# Altium project Xponent-tech.PrjPcb (part 2 of 2)

## Sheet 3_Band_Filter.SchDoc
size A4; DocumentNumber: 2; SheetNumber: 3; SheetTotal: 4
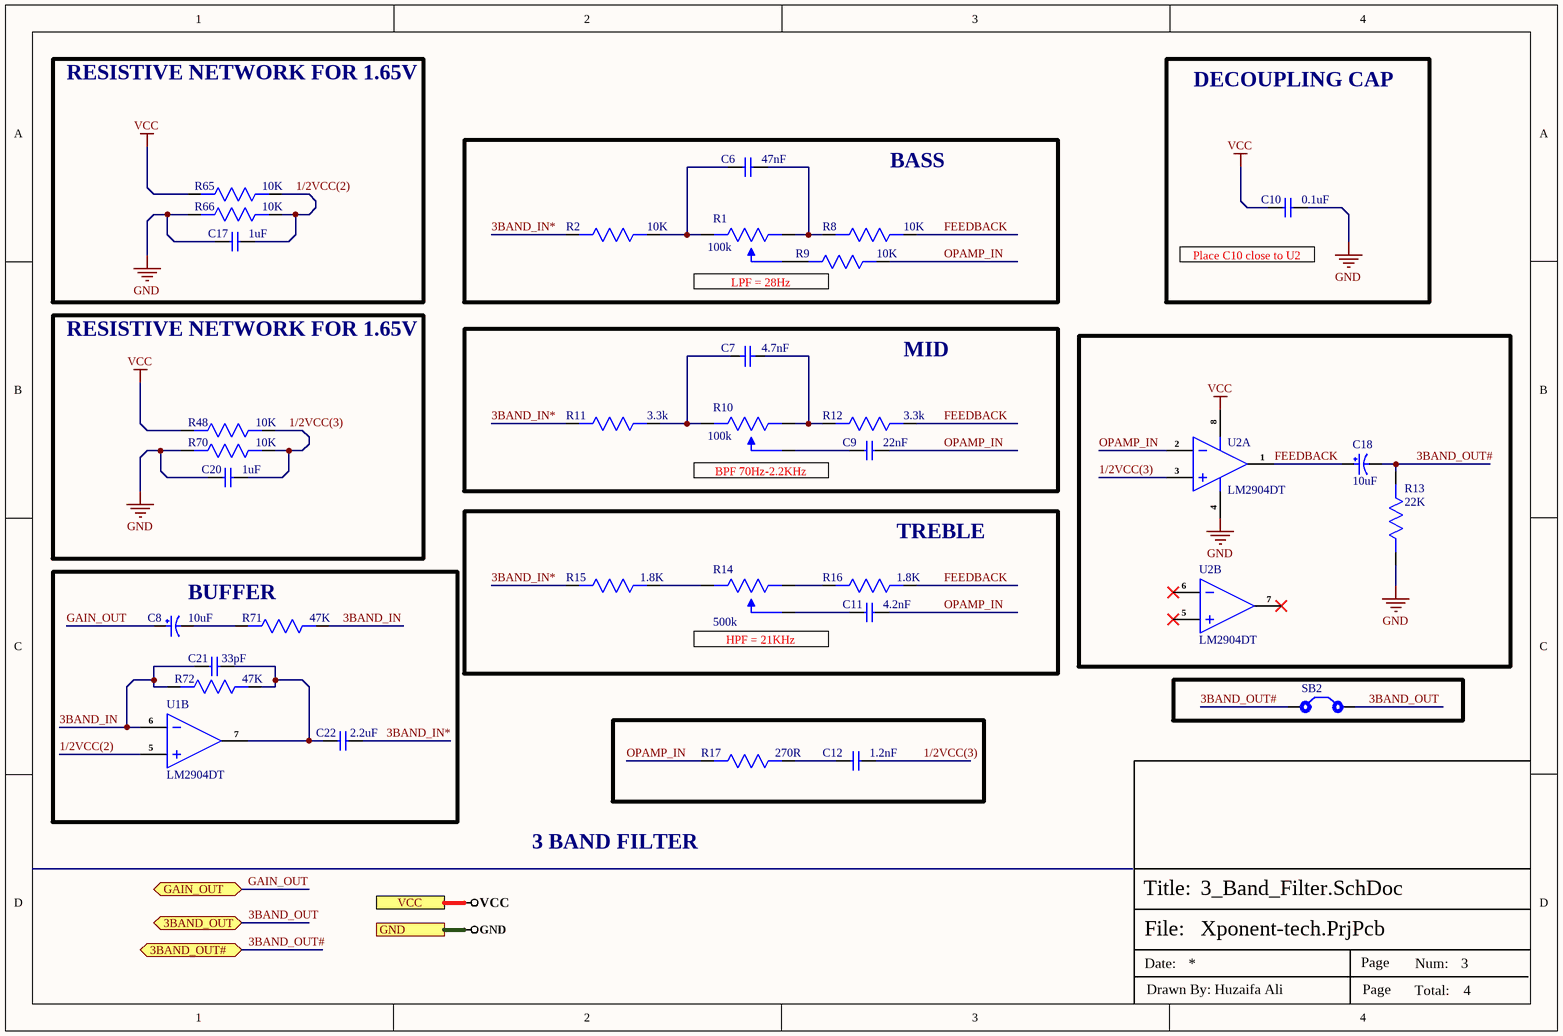
[diagram p2: 3_Band_Filter.SchDoc]

### Parts
C6  47nF  [Cap-0603]
C7  4.7nF  [Cap-0603]
C8  10uF  [RVT1E100M0405_]
C9  22nF  [Cap-0603]
C10  0.1uF  [CAP-0603]
C11  4.2nF  [Cap-0402]
C12  1.2nF  [Cap-0402]
C17  1uF  [Cap-0603]
C18  10uF  [RVT1E100M0405_]
C20  1uF  [Cap-0603]
C21  33pF  [Cap-0402]
C22  2.2uF  [Cap-0603]
R1  100k  [3296W_]
R2  10K  [Res-0603]
R8  10K  [Res-0603]
R9  10K  [Res-0603]
R10  100k  [3296W_]
R11  3.3k  [Res-0603]
R12  3.3k  [Res-0603]
R13  22K  [Res-0603]
R14  500k  [3296W_]
R15  1.8K  [Res-0603]
R16  1.8K  [Res-0603]
R17  270R  [Res-0603]
R48  10K  [Res-0603]
R65  10K  [Res-0603]
R66  10K  [Res-0603]
R70  10K  [Res-0603]
R71  47K  [Res-0603]
R72  47K  [Res-0603]
SB2  Solder Bridge  [Solder Bridge]  (value not drawn)
U1  LM2904DT  [SOIC-8]  (part B of 2)
U2  LM2904DT  [SOIC-8]  (parts A,B of 2)

### Blocks framed on the sheet
RESISTIVE NETWORK FOR 1.65V: C17 R65 R66
DECOUPLING CAP: C10
BASS: C6 R1 R2 R8 R9
RESISTIVE NETWORK FOR 1.65V: C20 R48 R70
MID: C7 C9 R10-R12
TREBLE: C11 R14-R16
BUFFER: C8 C21 C22 R71 R72 U1

### Ports
3BAND_OUT (bidir), 3BAND_OUT# (bidir), GAIN_OUT (bidir), GND, VCC

### Nets
GND: C10.2 C17.1 C20.1 R13.2 R66.2 R70.2 U2.4(VCC-) ; port GND
VCC: C10.1 R48.2 R65.2 U2.8(VCC+) ; port VCC
1/2VCC(2): C17.2 R65.1 R66.1 U1.5(2IN+)
1/2VCC(3): C12.2 C20.2 R48.1 R70.1 U2.3(IN+)
3BAND_IN: C21.1 R71.1 R72.2 U1.6(2IN-)
3BAND_IN*: C22.2 R2.2 R11.2 R15.2
3BAND_OUT: SB2.2 ; port 3BAND_OUT
3BAND_OUT#: C18.2 R13.1 SB2.1 ; port 3BAND_OUT#
FEEDBACK: C18.1 R8.1 R12.1 R16.1 U2.1(1OUT)
GAIN_OUT: C8.1 ; port GAIN_OUT
OPAMP_IN: C9.2 C11.2 R9.1 R17.2 U2.2(IN-)
NetC6_1: C6.1 R1.3(CW) R2.1
NetC6_2: C6.2 R1.1(CCW) R8.2
NetC7_1: C7.1 R10.1(CCW) R12.2
NetC7_2: C7.2 R10.3(CW) R11.1
NetC8_2: C8.2 R71.2
NetC9_1: C9.1 R10.2(Wiper)
NetC11_1: C11.1 R14.2(Wiper)
NetC12_1: C12.1 R17.1
NetC21_2: C21.2 C22.1 R72.1 U1.7(2OUT)
NetR1_2: R1.2(Wiper) R9.2
NetR14_1: R14.1(CCW) R16.2
NetR14_3: R14.3(CW) R15.1

Not connected (* = marked no-connect by the designer): U2 5(2IN+)* 6(2IN-)* 7(2OUT)*

### Notes on the sheet
- LPF = 28Hz
- (near C10) Place C10 close to U2
- (near R10) BPF 70Hz-2.2KHz
- (near R14) HPF = 21KHz
- 3 BAND FILTER
- File:
- Title:
- Date:
- Page
- Num:
- Total:
- Drawn By: Huzaifa Ali

### Library data of the parts
C6 = CGA3E2X8R1H473M080AA: CAP CER 0.047UF 50V X8R 0603; Manufacturer: TDK; Tolerance: 20%; Supplier 1: Digi-Key; Manufacturer Part Number: CGA3E2X8R1H473M080AA; RoHS: Yes; Category: Ceramic Capacitors; Stock 1: 1279; Pricing 1: 1=0.16000, 10=0.11200, 50=0.06360, 100=0.05260, 500=0.03690, 1000=0.03055 (USD); Mount: Surface Mount; Case/Package: 0603; Case Code (Metric): 1608; Weight: 7.1E-05oz; Case Code (Imperial): 0603; Min Operating Temperature: -55°C; Max Operating Temperature: 150°C; Dielectric: X8R; Voltage Rating (DC): 50V; Package Quantity: 4000; Packaging: Tape and Reel; Capacitance: 47nF; Voltage Rating: 50V; Features: High Temperature; Length: 0.063inch; Width: 0.031inch; Height: 0.8mm; Thickness: 0.035inch; Ratings: AEC-Q200; ComponentLink1URL: http://www.mouser.com/ds/2/400/mlcc_automotive_hightemp_en-520039.pdf?src-supplier=Mouser; ComponentLink1Description: http://www.mouser.com/ds/2/400/mlcc_automotive_hightemp_en-520039.pdf?src-supplier=Mouser; ComponentLink2URL: https://product.tdk.com/info/en/catalog/spec/mlccspec_automotive_hightemp_en.pdf?src-supplier=Digi-Key; ComponentLink2Description: https://product.tdk.com/info/en/catalog/spec/mlccspec_automotive_hightemp_en.pdf?src-supplier=Digi-Key; ComponentLink3URL: http://product.tdk.com/en/catalog/datasheets/mlcc_automotive_hightemp_en.pdf?src-supplier=Avnet; ComponentLink3Description: http://product.tdk.com/en/catalog/datasheets/mlcc_automotive_hightemp_en.pdf?src-supplier=Avnet; Supplier Part Number 1: 445-12603-1-ND; LCSC Part Number: C2172709
C7 = CC0603JRNPO9BN472: CAP CER 4700PF 50V C0G/NPO 0603; Manufacturer: Yageo; Item Type: Capacitor; Supplier 1: Digi-Key; Manufacturer Part Number: CC0603JRNPO9BN472; RoHS: Yes; Category: Ceramic Capacitors; Stock 1: 31779; Pricing 1: 1=0.48000, 10=0.33000, 50=0.23100, 100=0.19800, 500=0.14854, 1000=0.12543 (USD); RoHS Compliant: Yes; Supplier Part Number 1: 13-CC0603JRNPO9BN472CT-ND; LCSC Part Number: C576818; ComponentLink1Description: LCSC; ComponentLink1URL: https://www.lcsc.com/product-detail/Multilayer-Ceramic-Capacitors-MLCC-SMD-SMT_YAGEO-CC0603JRNPO9BN472_C576818.html
C8 C18 = RVT1E100M0405: CAP ALUM 10uF 25V SMD; Manufacturer: ROQANG; φD: 4mm; L: 5.4mm; Tolerance: ±20%; Item Type: Capacitor; Operating Temperature: -45℃~+105℃; Rated Voltage: 25V; Capacitance: 10uF; Manufacturer Part Number: RVT1E100M0405; ComponentLink1Description: LCSC; ComponentLink1URL: https://www.lcsc.com/product-detail/Aluminum-Electrolytic-Capacitors-SMD_10uF-25V-20_C72484.html; LCSC Part Number: C970655
C9 = CGA3E2X7R2A223K080AA: CAP CER 0.022UF 100V X7R 0603; Manufacturer: TDK; Tolerance: 10%; Supplier 1: Digi-Key; Manufacturer Part Number: CGA3E2X7R2A223K080AA; RoHS: Yes; Category: Ceramic Capacitors; Stock 1: 56079; Pricing 1: 1=0.11000, 10=0.07600, 50=0.04340, 100=0.03590, 500=0.02516, 1000=0.02083 (USD); Mount: Surface Mount; Case/Package: 0603; Case Code (Metric): 1608; Case Code (Imperial): 0603; Weight: 7.1E-05oz; Min Operating Temperature: -55°C; Max Operating Temperature: 125°C; Capacitance: 22nF; Voltage Rating: 100V; Packaging: Tape and Reel; Voltage Rating (DC): 100V; Dielectric: X7R; Termination: SMD/SMT; Series: CGA; Package Quantity: 1; Resistor Type: Ceramic; Length: 1.6mm; Width: 0.031inch; Height: 0.8mm; Thickness: 0.035inch; Depth: 0.8mm; Ratings: AEC-Q200; RoHS Compliant: Yes; REACH SVHC: No SVHC; ComponentLink1URL: https://datasheet.ciiva.com/22725/1735406-22725648.pdf?src-supplier=Element14; ComponentLink1Description: https://datasheet.ciiva.com/22725/1735406-22725648.pdf?src-supplier=Element14; ComponentLink2URL: https://datasheet.ciiva.com/24218/cga3e2x7r2a223k080aa-266292-24218959.pdf?src-supplier=Mouser; ComponentLink2Description: https://datasheet.ciiva.com/24218/cga3e2x7r2a223k080aa-266292-24218959.pdf?src-supplier=Mouser; ComponentLink3URL: https://datasheet.ciiva.com/7975/1807242-7975349.pdf?src-supplier=Element14; ComponentLink3Description: https://datasheet.ciiva.com/7975/1807242-7975349.pdf?src-supplier=Element14; Supplier Part Number 1: 445-5814-1-ND; LCSC Part Number: C2167165
C10 = CL10B104KB8NNNL: CAP CER 0.1UF 50V X7R 0603; Manufacturer: Samsung; Capacitance: 100nF; Tolerance: 10%; Supplier 1: Digi-Key; Manufacturer Part Number: CL10B104KB8NNNL; Stock 1: 3731229; Pricing 1: 1=0.1, 10=0.03, 50=0.0164, 100=0.0134, 500=0.00958, 1000=0.00753, 2500=0.00684, 5000=0.0063 (USD); Mount: Surface Mount; Case/Package: 0603; Min Operating Temperature: -55°C; Max Operating Temperature: 125°C; Dielectric: X7R; Packaging: Tape and Reel; Package Quantity: 15000; Voltage Rating: 50V; Voltage Rating (DC): 50V; Series: CL; Construction: Flat; Length: 1.6mm; Width: 0.031inch; Height: 0.8mm; Thickness: 0.035inch; Depth: 0.8mm; Radiation Hardening: No; RoHS Compliant: Yes; ComponentLink1URL: https://www.verical.com/server-webapp/html/getDatasheet?partID=357523&src-supplier=Verical; ComponentLink1Description: https://www.verical.com/server-webapp/html/getDatasheet?partID=357523&src-supplier=Verical; ComponentLink2URL: https://media.digikey.com/pdf/Data%20Sheets/Samsung%20PDFs/CL_Series_MLCC_ds.pdf?src-supplier=Digi-Key; ComponentLink2Description: https://media.digikey.com/pdf/Data%20Sheets/Samsung%20PDFs/CL_Series_MLCC_ds.pdf?src-supplier=Digi-Key; Supplier Part Number 1: 1276-CL10B104KB8NNNLCT-ND; LCSC Part Number: C913912
C11 = GCM155R72A472KA01D: 100V 4.2nF X7R ±10% 0402 Multilayer Ceramic Capacitors MLCC - SMD/SMT ROHS; Manufacturer: Murata Electronics; Manufacturer Part Number: GCM155R72A472KA01D; LCSC Part Number: C2980803; Item Type: Capacitor; ComponentLink1Description: LCSC; ComponentLink1URL: https://www.lcsc.com/product-detail/Multilayer-Ceramic-Capacitors-MLCC-SMD-SMT_Murata-Electronics-GCM155R72A472KA01D_C2980803.html; Value: 4.2nF
C12 = C0402C122K3RAC7867: CAP CER 1200PF 25V X7R 0402; Manufacturer: KEMET; Dielectric Material: Ceramic; Tolerance: 10%; Supplier 1: Digi-Key; Manufacturer Part Number: C0402C122K3RAC7867; Stock 1: 13198; Pricing 1: 1=0.38, 10=0.266, 50=0.1864, 100=0.1597, 500=0.1198, 1000=0.10117, 2500=0.09584, 5000=0.09052 (USD); Mount: Surface Mount; Case/Package: 0402; Contact Plating: Tin,Matte; Min Operating Temperature: -55°C; Max Operating Temperature: 125°C; Capacitance: 1.2nF; Dielectric: X7R; Packaging: Tape and Reel; Voltage Rating (DC): 25V; Construction: Flat; Length: 1mm; Height: 0.5mm; Depth: 0.5mm; Radiation Hardening: No; RoHS Compliant: Yes; Supplier Part Number 1: 399-14419-1-ND; LCSC Part Number: C3895723
C17 C20 = UMK107AB7105KA-T: CAP CER 1UF 50V X7R 0603; Manufacturer: Taiyo Yuden; Tolerance: 10%; Item Type: Capacitor; ComponentLink1URL: http://www.farnell.com/datasheets/2048165.pdf?src-supplier=Element14; ComponentLink1Description: http://www.farnell.com/datasheets/2048165.pdf?src-supplier=Element14; ComponentLink2URL: https://www.murata.com/~/media/webrenewal/support/library/catalog/products/capacitor/mlcc/c02e.ashx?la=en-us&src-supplier=Digi-Key; ComponentLink2Description: https://www.murata.com/~/media/webrenewal/support/library/catalog/products/capacitor/mlcc/c02e.ashx?la=en-us&src-supplier=Digi-Key; Supplier 1: Digi-Key; Manufacturer Part Number: UMK107AB7105KA-T; Stock 1: 453098; Pricing 1: 1=0.28, 10=0.19, 100=0.1079, 500=0.0762, 1000=0.0667 (USD); Mount: Surface Mount; Case/Package: 0603; Case Code (Metric): 1608; Case Code (Imperial): 0603; Min Operating Temperature: -55°C; Max Operating Temperature: 125°C; Packaging: Tape and Reel; Package Quantity: 1; Capacitance: 1uF; Voltage Rating: 50V; Voltage Rating (DC): 50V; Dielectric: X7R; Termination: SMD/SMT; Length: 1.6mm; Height: 0.8mm; Width: 0.031inch; Thickness: 0.037inch; Depth: 0.8mm; Radiation Hardening: No; Halogen Free: Halogen Free; ComponentLink3URL: https://www.yuden.co.jp/productdata/catalog/mlcc_all_e.pdf?src-supplier=Digi-Key; ComponentLink3Description: https://www.yuden.co.jp/productdata/catalog/mlcc_all_e.pdf?src-supplier=Digi-Key; ComponentLink4URL: https://www.yuden.co.jp/productdata/catalog/mlcc_all_e.pdf?src-supplier=Onlinecomponents.com; ComponentLink4Description: https://www.yuden.co.jp/productdata/catalog/mlcc_all_e.pdf?src-supplier=Onlinecomponents.com; Supplier Part Number 1: 587-3247-1-ND; LCSC Part Number: C105174
C21 = GRM1555C1E330JA01D: CAP CER 33PF 25V C0G/NP0 0402; Manufacturer: Murata; Tolerance: 5%; Dielectric: C0G; Supplier 1: Digi-Key; Manufacturer Part Number: GRM1555C1E330JA01D; Stock 1: 250773; Pricing 1: 1=0.1, 10=0.034, 50=0.0184, 100=0.0151, 500=0.01078, 1000=0.00847, 2500=0.0077, 5000=0.00708 (USD); Mount: Surface Mount; Case/Package: 0402; Case Code (Metric): 1005; Case Code (Imperial): 0402; Min Operating Temperature: -55°C; Max Operating Temperature: 125°C; Capacitance: 33pF; Package Quantity: 1; Voltage Rating: 25V; Packaging: Tape and Reel; Voltage Rating (DC): 25V; Termination: SMD/SMT; Voltage: 25V; Series: GRM; Construction: Flat; Length: 1mm; Width: 0.02inch; Height: 0.5mm; Thickness: 0.022inch; Depth: 0.5mm; Radiation Hardening: No; Lead Free: Lead Free; RoHS Compliant: Yes; ComponentLink1URL: https://www.murata.com/~/media/webrenewal/support/library/catalog/products/capacitor/mlcc/c02e.ashx?la=en-us&src-supplier=Digi-Key; ComponentLink1Description: https://www.murata.com/~/media/webrenewal/support/library/catalog/products/capacitor/mlcc/c02e.ashx?la=en-us&src-supplier=Digi-Key; ComponentLink2URL: http://www.mouser.com/ds/2/281/c02e-2905.pdf?src-supplier=Mouser; ComponentLink2Description: http://www.mouser.com/ds/2/281/c02e-2905.pdf?src-supplier=Mouser; ComponentLink3URL: http://psearch.murata.com/capacitor/product/GRM1555C1E330JA01%23.pdf?src-supplier=Avnet; ComponentLink3Description: http://psearch.murata.com/capacitor/product/GRM1555C1E330JA01%23.pdf?src-supplier=Avnet; Supplier Part Number 1: 490-6177-1-ND; LCSC Part Number: C441758
C22 = GRM188R6YA225KA12D: CAP, 2.2µF, 35V, 10%, X5R, 0603; Manufacturer: Murata; Material: Ceramic; Supplier 1: Digi-Key; Manufacturer Part Number: GRM188R6YA225KA12D; RoHS: Yes; Category: Ceramic Capacitors; Stock 1: 81665; Pricing 1: 1=0.21000, 10=0.14100, 50=0.08480, 100=0.07170, 500=0.04904, 1000=0.04338 (USD); Mount: Surface Mount; Case/Package: 0603; Case Code (Metric): 1608; Case Code (Imperial): 0603; Weight: 0.000222oz; Min Operating Temperature: -55°C; Max Operating Temperature: 85°C; Package Quantity: 4000; Packaging: Tape and Reel; Capacitance: 2.2uF; Tolerance: 10%; Voltage Rating: 35V; Dielectric: X5R; Voltage: 35V; Termination: SMD/SMT; Voltage Rating (DC): 35V; Series: GRM; Length: 1.6mm; Width: 0.8mm; Height: 0.8mm; Thickness: 0.035inch; Depth: 0.8mm; REACH SVHC: No SVHC; Lead Free: Lead Free; RoHS Compliant: Yes; ComponentLink1URL: https://datasheet.ciiva.com/14906/partnumbering-e-01-14906490.pdf?src-supplier=Digi-Key; ComponentLink1Description: https://datasheet.ciiva.com/14906/partnumbering-e-01-14906490.pdf?src-supplier=Digi-Key; ComponentLink2URL: https://datasheet.ciiva.com/14906/partnumbering-e-01-14906491.pdf?src-supplier=Digi-Key; ComponentLink2Description: https://datasheet.ciiva.com/14906/partnumbering-e-01-14906491.pdf?src-supplier=Digi-Key; ComponentLink3URL: https://datasheet.ciiva.com/14906/partnumbering-e-01-14906492.pdf?src-supplier=Digi-Key; ComponentLink3Description: https://datasheet.ciiva.com/14906/partnumbering-e-01-14906492.pdf?src-supplier=Digi-Key; Supplier Part Number 1: 490-7204-1-ND; LCSC Part Number: C86017
R1 R10 = 3296W-1-104: Trimmer, Cermet, Rest 100 Kilohms, PCB, 25 Turns, Pwr-Rtg 0.5W, 3296 Series; Manufacturer: BOCHEN(Chengdu Guosheng Tech); Item Type: Potentiometer; Manufacturer Part Number: 3296W-1-104; LCSC Part Number: C330435; Value: 100k; ComponentLink1Description: LCSC; ComponentLink1URL: https://www.lcsc.com/product-detail/Variable-Resistors-Potentiometers_BOCHEN-Chengdu-Guosheng-Tech-3296W-1-104_C330435.html
R2 R8 R9 R48 R65 R66 R70 = RT0603BRD0710KL: RES SMD 10K OHM 0.1% 1/10W 0603; Manufacturer: Yageo; Power: 100mW; Rated Temperature: 70°C; Value: 10kR; Temperature Coefficient: 25ppm/°C; Working Voltage: 75V; Package Height: 0.45mm; Package Length: 1.6mm; Package Width: 0.8mm; Item Type: Resistor; Supplier 1: Rs; Manufacturer Part Number: RT0603BRD0710KL; RoHS: Yes; Category: Chip SMD Resistors; Stock 1: 20510; Pricing 1: 100=0.29800, 250=0.27800, 500=0.25900, 1000=0.23700 (GBP); Mounting Technology: Surface Mount; Pins: 2; Case/Package: 0603; Min Operating Temperature: -55°C; Max Operating Temperature: 155°C; Tolerance: 0.1%; Resistor Type: FIXED RESISTOR; Construction: Chip; Package Style: SMTMeter; Packaging: Tape and Reel; Technology: THIN FILM; Termination: Wraparound; Reach SVHC Compliant: Yes; RoHS Compliant: Yes; ComponentLink1URL: https://datasheet.ciiva.com:443/pdfs/VipMasterIC/IC/YAGO/YAGO-S-A0008510989/YAGO-S-A0008510989-1.pdf?src-supplier=IHS+Markit; ComponentLink1Description: https://datasheet.ciiva.com:443/pdfs/VipMasterIC/IC/YAGO/YAGO-S-A0008510989/YAGO-S-A0008510989-1.pdf?src-supplier=IHS+Markit; ComponentLink2URL: https://datasheet.ciiva.com/5624/pyu-rt-1-to-0-05-rohs-l-4-5624351.pdf?src-supplier=Mouser; ComponentLink2Description: https://datasheet.ciiva.com/5624/pyu-rt-1-to-0-05-rohs-l-4-5624351.pdf?src-supplier=Mouser; ComponentLink3URL: https://datasheet.ciiva.com/29721/pyu-rt-1-to-0-05-rohs-l-4-29721177.pdf?src-supplier=Digi-Key; ComponentLink3Description: https://datasheet.ciiva.com/29721/pyu-rt-1-to-0-05-rohs-l-4-29721177.pdf?src-supplier=Digi-Key; Supplier Part Number 1: 1991391P; LCSC Part Number: C95204
R11 R12 = RT0603BRD073K3L: RES SMD 3.3K OHM 0.1% 1/10W 0603; Manufacturer: Yageo; Resistance: 3.3kR; Power Rating: 100mW; Voltage Rating: 75V; Temperature Coefficient: 25ppm/°C; Voltage Rating (DC): 50V; Item Type: Resistor; Supplier 1: Arrow Electronics; Manufacturer Part Number: RT0603BRD073K3L; RoHS: Yes; Category: Chip SMD Resistors; Stock 1: 2417; Pricing 1: 1=0.30610, 10=0.21080, 25=0.17430, 100=0.09180, 250=0.09000, 500=0.07600, 1000=0.04220 (USD); Case/Package: 0603; Case Code (Metric): 1608; Case Code (Imperial): 0603; Contact Plating: Tin,Lead; Min Operating Temperature: -55°C; Max Operating Temperature: 125°C; Package Quantity: 5000; Packaging: Tape and Reel; Tolerance: 0.1%; Resistor Type: Thin Film; Number of Terminations: 2; Termination: SMD/SMT; Max Power Dissipation: 100mW; Features: Moisture Resistant; Series: RT; Construction: Rectangular; Length: 0.063inch; Width: 0.031inch; Height: 0.022inch; Depth: 0.8mm; Military Standard: Not; Lead Free: Lead Free; RoHS Compliant: Yes; ComponentLink1URL: https://datasheet.ciiva.com/11814/0900766b8027bd26-11814026.pdf?src-supplier=Rs; ComponentLink1Description: https://datasheet.ciiva.com/11814/0900766b8027bd26-11814026.pdf?src-supplier=Rs; ComponentLink2URL: https://datasheet.ciiva.com/12694/pyu-rt-1-to-0-05-rohs-l-4-12694839.pdf?src-supplier=Mouser; ComponentLink2Description: https://datasheet.ciiva.com/12694/pyu-rt-1-to-0-05-rohs-l-4-12694839.pdf?src-supplier=Mouser; ComponentLink3URL: https://datasheet.ciiva.com/2585/pyu-rt-1-to-0-05-rohs-l-4-2585926.pdf?src-supplier=Digi-Key; ComponentLink3Description: https://datasheet.ciiva.com/2585/pyu-rt-1-to-0-05-rohs-l-4-2585926.pdf?src-supplier=Digi-Key; Supplier Part Number 1: RT0603BRD073K3L; LCSC Part Number: C309653
R13 = RT0603BRD0722KL: RES SMD 22K OHM 0.1% 1/10W 0603; Manufacturer: Yageo; Resistance: 22kR; Power Rating: 100mW; Voltage Rating: 75V; Temperature Coefficient: 25ppm/°C; Voltage Rating (DC): 50V; Item Type: Resistor; Supplier 1: Future Electronics; Manufacturer Part Number: RT0603BRD0722KL; RoHS: Yes; Category: Chip SMD Resistors; Stock 1: 75005; Pricing 1: 5000=0.02230, 15000=0.02150, 25000=0.02110, 50000=0.02060, 100000=0.01990 (USD); Case/Package: 0603; Case Code (Imperial): 0603; Case Code (Metric): 1608; Weight: 7.1E-05oz; Contact Plating: Tin,Lead; Min Operating Temperature: -55°C; Max Operating Temperature: 155°C; Packaging: Tape and Reel; Tolerance: 0.1%; Resistor Type: Thin Film; Number of Terminations: 2; Termination: SMD/SMT; Max Power Dissipation: 100mW; Features: Moisture Resistant; Series: RT; Length: 0.063inch; Width: 0.031inch; Height: 0.022inch; Lead Free: Lead Free; RoHS Compliant: Yes; ComponentLink1URL: https://datasheet.ciiva.com/12836/pyu-rt-1-to-0-05-rohs-l-4-12836650.pdf?src-supplier=Mouser; ComponentLink1Description: https://datasheet.ciiva.com/12836/pyu-rt-1-to-0-05-rohs-l-4-12836650.pdf?src-supplier=Mouser; LCSC Part Number: C469656; Supplier Part Number 1: 3017560
R14 = 3296W-1-504: Res Cermet Trimmer 500K Ohm 10% 1/2W 25(Elec)Turn; Manufacturer: BOCHEN(Chengdu Guosheng Tech); Item Type: Potentiometer; Manufacturer Part Number: 3296W-1-504; LCSC Part Number: C330437; ComponentLink1Description: LCSC; ComponentLink1URL: https://www.lcsc.com/product-detail/Variable-Resistors-Potentiometers_BOCHEN-Chengdu-Guosheng-Tech-3296W-1-504_C330437.html; Value: 500k
R15 R16 = RT0603BRD071K8L: RES SMD 1.8K OHM 0.1% 1/10W 0603; Manufacturer: Yageo; Resistance: 1.8kR; Temperature Coefficient: 25ppm/°C; Power Rating: 100mW; Voltage Rating: 75V; Voltage Rating (DC): 50V; Item Type: Resistor; Supplier 1: Rs; Manufacturer Part Number: RT0603BRD071K8L; RoHS: Yes; Category: Chip SMD Resistors; Stock 1: 3210; Pricing 1: 100=0.21900, 250=0.20400, 500=0.19000, 1000=0.17400 (GBP); Case/Package: 0603; Contact Plating: Tin,Matte; Case Code (Metric): 1608; Case Code (Imperial): 0603; Min Operating Temperature: -55°C; Max Operating Temperature: 125°C; Tolerance: 0.1%; Resistor Type: Thin Film; Package Quantity: 5000; Packaging: Tape and Reel; Number of Terminations: 2; Termination: SMD/SMT; Max Power Dissipation: 100mW; Features: Moisture Resistant; Series: RT; Construction: Rectangular; Length: 0.063inch; Width: 0.031inch; Height: 0.022inch; Depth: 0.8mm; Radiation Hardening: No; Military Standard: Not; Lead Free: Lead Free; RoHS Compliant: Yes; ComponentLink1URL: https://datasheet.ciiva.com/12694/pyu-rt-1-to-0-05-rohs-l-4-12694842.pdf?src-supplier=Mouser; ComponentLink1Description: https://datasheet.ciiva.com/12694/pyu-rt-1-to-0-05-rohs-l-4-12694842.pdf?src-supplier=Mouser; ComponentLink2URL: https://datasheet.ciiva.com/2585/pyu-rt-1-to-0-05-rohs-l-4-2585762.pdf?src-supplier=Digi-Key; ComponentLink2Description: https://datasheet.ciiva.com/2585/pyu-rt-1-to-0-05-rohs-l-4-2585762.pdf?src-supplier=Digi-Key; Supplier Part Number 1: 1991446P; LCSC Part Number: C705745
R17 = RT0603BRE07270RL: RES SMD 270 OHM 0.1% 1/10W 0603; Manufacturer: Yageo; Max Power Dissipation: 100mW; Temperature Coefficient: 50ppm/°C; Voltage Rating (DC): 50V; Item Type: Resistor; Supplier 1: Digi-Key; Manufacturer Part Number: RT0603BRE07270RL; RoHS: Yes; Category: Chip SMD Resistors; Pricing 1: 5000=0.04770 (USD); Case/Package: 0603; Min Operating Temperature: -55°C; Max Operating Temperature: 125°C; Resistance: 270R; Tolerance: 0.1%; Packaging: Tape and Reel; Package Quantity: 5000; Resistor Type: Thin Film; Number of Terminations: 2; Series: RT; Construction: Rectangular; Length: 0.063inch; Width: 0.031inch; Height: 0.022inch; Depth: 0.8mm; Military Standard: Not; Lead Free: Lead Free; RoHS Compliant: Yes; ComponentLink1URL: https://datasheet.ciiva.com/2584/pyu-rt-1-to-0-05-rohs-l-5-2584379.pdf?src-supplier=Digi-Key; ComponentLink1Description: https://datasheet.ciiva.com/2584/pyu-rt-1-to-0-05-rohs-l-5-2584379.pdf?src-supplier=Digi-Key; Supplier Part Number 1: RT0603BRE07270RL-ND; LCSC Part Number: C705836
R71 R72 = RT0603BRD0747KL: RES SMD 47K OHM 0.1% 1/10W 0603; Manufacturer: Yageo; Voltage Rating: 75V; Resistance: 47kR; Power Rating: 100mW; Temperature Coefficient: 25ppm/°C; Voltage Rating (DC): 50V; Item Type: Resistor; Supplier 1: Arrow Electronics; Manufacturer Part Number: RT0603BRD0747KL; RoHS: Yes; Category: Chip SMD Resistors; Stock 1: 5153; Pricing 1: 1=0.29190, 10=0.22910, 25=0.22680, 100=0.09530, 250=0.09440, 500=0.09340, 1000=0.04780, 3000=0.03070 (USD); Case/Package: 0603; Case Code (Metric): 1608; Case Code (Imperial): 0603; Contact Plating: Tin,Lead; Min Operating Temperature: -55°C; Max Operating Temperature: 125°C; Packaging: Tape and Reel; Package Quantity: 5000; Resistor Type: Thin Film; Termination: SMD/SMT; Number of Terminations: 2; Max Power Dissipation: 100mW; Features: Moisture Resistant; Series: RT; Construction: Rectangular; Length: 0.063inch; Width: 0.031inch; Height: 0.022inch; Depth: 0.8mm; Military Standard: Not; Lead Free: Lead Free; RoHS Compliant: Yes; ComponentLink1URL: https://datasheet.ciiva.com/2585/pyu-rt-1-to-0-05-rohs-l-4-2585964.pdf?src-supplier=Digi-Key; ComponentLink1Description: https://datasheet.ciiva.com/2585/pyu-rt-1-to-0-05-rohs-l-4-2585964.pdf?src-supplier=Digi-Key; ComponentLink2URL: https://datasheet.ciiva.com/46635/pyu-rt-1-to-0-05-rohs-l-5-46635309.pdf?src-supplier=Digi-Key; ComponentLink2Description: https://datasheet.ciiva.com/46635/pyu-rt-1-to-0-05-rohs-l-5-46635309.pdf?src-supplier=Digi-Key; Supplier Part Number 1: RT0603BRD0747KL; LCSC Part Number: C326725
SB2 = Solder Bridge: Solder Bridge ON; Manufacturer Part Number: Solder Bridge; Item Type: Solder Bridge
U1 U2 = LM2904DT: General Purpose Amplifier 2 Circuit  8-SO; Manufacturer: STMicroelectronics; Number of Terminals/Pins: 8; Package Body Material: Plastic; Number of Channels: 2; Bandwidth: 1.1MHz; Max Supply Voltage: 30V; Min Supply Voltage: 3V; Min Dual Supply Voltage: 1.5V; Max Dual Supply Voltage: 15V; Voltage Gain: 100dB; Output Current: 40mA; Slew Rate: 0.6V/µs; Nominal Supply Current: 1.2mA; Common Mode Rejection Ratio: 70dB; Input Offset Voltage (Vos): 7mV; Input Bias Current: 150nA; Operating Supply Current: 700uA; Dual Supply Voltage: 9V; Max Supply Current: 32mA; Time @ Peak Reflow Temperature-Max (s): 40s; Item Type: IC; Supplier 1: Mouser; Manufacturer Part Number: LM2904DT; RoHS: Yes; Category: Amplifiers - Op Amps, Buffer, Instrumentation; Stock 1: 104539; Pricing 1: 1=0.44000, 10=0.34900, 50=0.34900, 100=0.25900, 1000=0.17000, 10000=0.15000 (USD); Mount: Surface Mount; Case/Package: SOIC; Number of Pins: 8; Contact Plating: Gold; Weight: 0.01lb; Package Shape: Rectangular; Terminal Finish: Nickel; Min Operating Temperature: -40°C; Max Operating Temperature: 125°C; Packaging: Tape and Reel; Gain Bandwidth Product: 1.1MHz; Number of Circuits: 2; Package Quantity: 2500; Operating Supply Voltage: 15V; Supply Current: 1.2mA; Technology: BIPOLAR; Series: -; Output Current per Channel: 40mA; Number of Elements: 2; Number of Amplifiers: 2; Amplifier Type: GENERAL PURPOSE; Unity Gain Bandwidth Product: 1.1MHz; Number of Functions: 2; Terminal Form: Gull Wing; Terminal Position: DUAL; Moisture Sensitivity Level: 1; JESD-30 Code: R-PDSO-G8; Surface Mount: Yes; Peak Reflow Temperature (Cel): 260°C; Input Offset Voltage-Max: 7mV; Slew Rate-Nom: 0.6V/µs; Length: 4.9mm; Width: 3.9mm; Height: 1.25mm; Radiation Hardening: No; Reach SVHC Compliant: Yes; Lead Free: Contains Lead; RoHS Compliant: Yes; Temperature Grade: AUTOMOTIVE; ComponentLink1URL: https://datasheet.ciiva.com/5703/1802155-5703335.pdf?src-supplier=Farnell; ComponentLink1Description: https://datasheet.ciiva.com/5703/1802155-5703335.pdf?src-supplier=Farnell; ComponentLink2URL: https://datasheet.ciiva.com/27055/1993227-27055857.pdf?src-supplier=Jameco; ComponentLink2Description: https://datasheet.ciiva.com/27055/1993227-27055857.pdf?src-supplier=Jameco; ComponentLink3URL: https://datasheet.ciiva.com/15129/getdatasheetpartid-32489-15129656.pdf?src-supplier=Verical; ComponentLink3Description: https://datasheet.ciiva.com/15129/getdatasheetpartid-32489-15129656.pdf?src-supplier=Verical; ComponentLink4URL: https://datasheet.ciiva.com/41459/001185000-da-01-en-ic-op-amp-low-pwr-du-lm2904dt-soic-8-stm-41459659.pdf?src-supplier=Conrad; ComponentLink4Description: https://datasheet.ciiva.com/41459/001185000-da-01-en-ic-op-amp-low-pwr-du-lm2904dt-soic-8-stm-41459659.pdf?src-supplier=Conrad; ComponentLink5URL: https://datasheet.ciiva.com/1795/cd00000535-1795476.pdf?src-supplier=Digi-Key; ComponentLink5Description: https://datasheet.ciiva.com/1795/cd00000535-1795476.pdf?src-supplier=Digi-Key; ComponentLink6URL: https://datasheet.ciiva.com/1795/cd00000535-1795475.pdf?src-supplier=Digi-Key; ComponentLink6Description: https://datasheet.ciiva.com/1795/cd00000535-1795475.pdf?src-supplier=Digi-Key; ComponentLink7URL: https://datasheet.ciiva.com/1795/cd00000535-1795477.pdf?src-supplier=Digi-Key; ComponentLink7Description: https://datasheet.ciiva.com/1795/cd00000535-1795477.pdf?src-supplier=Digi-Key; ComponentLink8URL: https://datasheet.ciiva.com/16200/cd00000535-16200605.pdf?src-supplier=Future+Electronics; ComponentLink8Description: https://datasheet.ciiva.com/16200/cd00000535-16200605.pdf?src-supplier=Future+Electronics; Supplier Part Number 1: 511-LM2904DT; LCSC Part Number: C105411

## Sheet Gain.SchDoc
size A4; DocumentNumber: 1; SheetNumber: 2; SheetTotal: 4
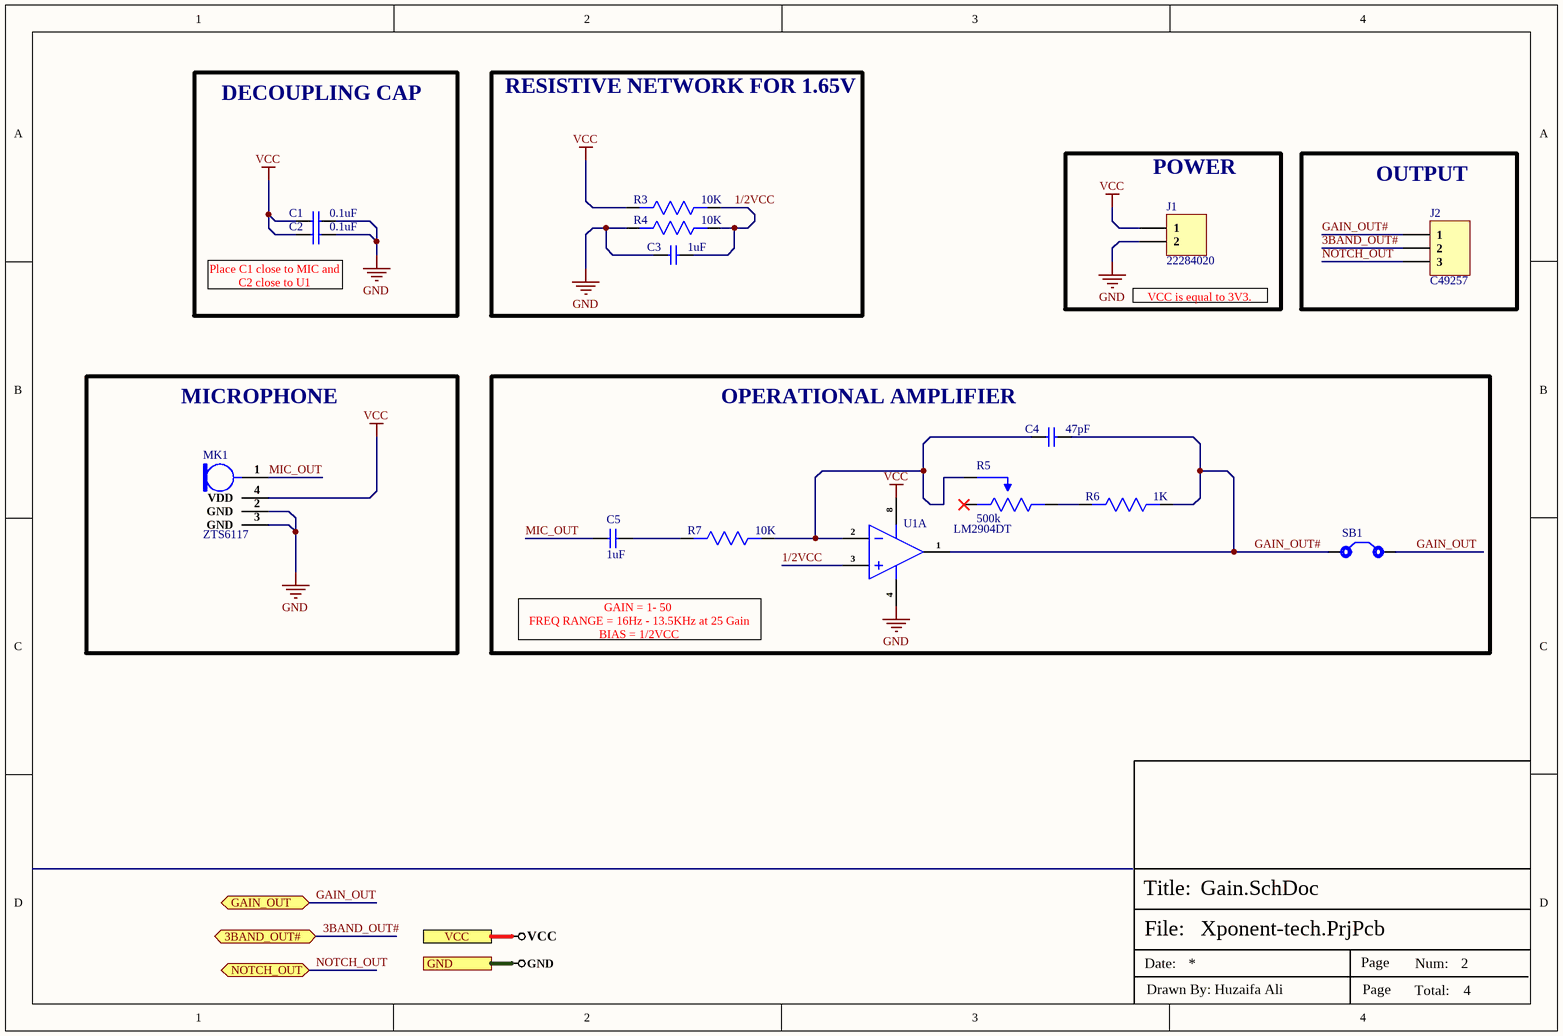
[diagram p3: Gain.SchDoc]

### Parts
C1  0.1uF  [CAP-0603]
C2  0.1uF  [CAP-0603]
C3  1uF  [Cap-0603]
C4  47pF  [Cap-0603]
C5  1uF  [Cap-0603]
J1  22284020  [HDR1X2_]
J2  C49257  [HDR1X3_]
MK1  ZTS6117  [ZTS6117_]
R3  10K  [Res-0603]
R4  10K  [Res-0603]
R5  500k  [VG039NCHXTB504_]
R6  1K  [Res-0603]
R7  10K  [Res-0603]
SB1  Solder Bridge  [Solder Bridge]  (value not drawn)
U1  LM2904DT  [SOIC-8]  (part A of 2)

### Blocks framed on the sheet
DECOUPLING CAP: C1 C2
RESISTIVE NETWORK FOR 1.65V: C3 R3 R4
POWER: J1
OUTPUT: J2
MICROPHONE: MK1
OPERATIONAL AMPLIFIER: C4 C5 R5-R7 SB1 U1

### Ports
3BAND_OUT# (bidir), GAIN_OUT (bidir), GND, NOTCH_OUT (bidir), VCC

### Nets
GND: C1.2 C2.2 C3.1 J1.2 MK1.2(GND) MK1.3(GND) R4.2 U1.4(VCC-) ; port GND
VCC: C1.1 C2.1 J1.1 MK1.4(VDD) R3.2 U1.8(VCC+) ; port VCC
1/2VCC: C3.2 R3.1 R4.1 U1.3(IN+)
3BAND_OUT#: J2.2 ; port 3BAND_OUT#
GAIN_OUT: SB1.2 ; port GAIN_OUT
GAIN_OUT#: C4.2 J2.1 R6.1 SB1.1 U1.1(1OUT)
MIC_OUT: C5.1 MK1.1(OUT)
NOTCH_OUT: J2.3 ; port NOTCH_OUT
NetC4_1: C4.1 R5.2(Wiper) R7.1 U1.2(IN-)
NetC5_2: C5.2 R7.2
NetR5_3: R5.3(CW) R6.2

Not connected (* = marked no-connect by the designer): R5 1(CCW)*

### Notes on the sheet
- Place C1 close to MIC and C2 close to U1
- (near J1) VCC is equal to 3V3.
- GAIN = 1- 50
  FREQ RANGE = 16Hz - 13.5KHz at 25 Gain
  BIAS = 1/2VCC
- File:
- Title:
- Date:
- Page
- Num:
- Total:
- Drawn By: Huzaifa Ali

### Library data of the parts
C1 C2 = CL10B104KB8NNNL: as C10 on sheet 3_Band_Filter; Supplier 1: Digi-Key; Manufacturer Part Number: CL10B104KB8NNNL; Stock 1: 3731229; Pricing 1: 1=0.1, 10=0.03, 50=0.0164, 100=0.0134, 500=0.00958, 1000=0.00753, 2500=0.00684, 5000=0.0063 (USD); Mount: Surface Mount; Case/Package: 0603; Min Operating Temperature: -55°C; Max Operating Temperature: 125°C; Dielectric: X7R; Packaging: Tape and Reel; Package Quantity: 15000; Voltage Rating: 50V; Voltage Rating (DC): 50V; Series: CL; Construction: Flat; Length: 1.6mm; Width: 0.031inch; Height: 0.8mm; Thickness: 0.035inch; Depth: 0.8mm; Radiation Hardening: No; RoHS Compliant: Yes; ComponentLink1URL: https://www.verical.com/server-webapp/html/getDatasheet?partID=357523&src-supplier=Verical; ComponentLink1Description: https://www.verical.com/server-webapp/html/getDatasheet?partID=357523&src-supplier=Verical; ComponentLink2URL: https://media.digikey.com/pdf/Data%20Sheets/Samsung%20PDFs/CL_Series_MLCC_ds.pdf?src-supplier=Digi-Key; ComponentLink2Description: https://media.digikey.com/pdf/Data%20Sheets/Samsung%20PDFs/CL_Series_MLCC_ds.pdf?src-supplier=Digi-Key; Supplier Part Number 1: 1276-CL10B104KB8NNNLCT-ND; LCSC Part Number: C913912
C3 C5 = UMK107AB7105KA-T: as C17 on sheet 3_Band_Filter; ComponentLink1URL: http://www.farnell.com/datasheets/2048165.pdf?src-supplier=Element14; ComponentLink1Description: http://www.farnell.com/datasheets/2048165.pdf?src-supplier=Element14; ComponentLink2URL: https://www.murata.com/~/media/webrenewal/support/library/catalog/products/capacitor/mlcc/c02e.ashx?la=en-us&src-supplier=Digi-Key; ComponentLink2Description: https://www.murata.com/~/media/webrenewal/support/library/catalog/products/capacitor/mlcc/c02e.ashx?la=en-us&src-supplier=Digi-Key; Supplier 1: Digi-Key; Manufacturer Part Number: UMK107AB7105KA-T; Stock 1: 453098; Pricing 1: 1=0.28, 10=0.19, 100=0.1079, 500=0.0762, 1000=0.0667 (USD); Mount: Surface Mount; Case/Package: 0603; Case Code (Metric): 1608; Case Code (Imperial): 0603; Min Operating Temperature: -55°C; Max Operating Temperature: 125°C; Packaging: Tape and Reel; Package Quantity: 1; Capacitance: 1uF; Voltage Rating: 50V; Voltage Rating (DC): 50V; Dielectric: X7R; Termination: SMD/SMT; Length: 1.6mm; Height: 0.8mm; Width: 0.031inch; Thickness: 0.037inch; Depth: 0.8mm; Radiation Hardening: No; Halogen Free: Halogen Free; ComponentLink3URL: https://www.yuden.co.jp/productdata/catalog/mlcc_all_e.pdf?src-supplier=Digi-Key; ComponentLink3Description: https://www.yuden.co.jp/productdata/catalog/mlcc_all_e.pdf?src-supplier=Digi-Key; ComponentLink4URL: https://www.yuden.co.jp/productdata/catalog/mlcc_all_e.pdf?src-supplier=Onlinecomponents.com; ComponentLink4Description: https://www.yuden.co.jp/productdata/catalog/mlcc_all_e.pdf?src-supplier=Onlinecomponents.com; Supplier Part Number 1: 587-3247-1-ND; LCSC Part Number: C105174
C4 = AC0603JRNPO0BN470: CAP CER 47PF 100V NPO 0603; Manufacturer: Yageo; Zener Voltage: 33V; Tolerance: 6.06%; Max Power Dissipation: 250mW; Impedance: 80R; Item Type: Capacitor; Supplier 1: Digi-Key; Manufacturer Part Number: AC0603JRNPO0BN470; Stock 1: 4954; Pricing 1: 1=0.16, 10=0.115, 100=0.0542, 500=0.03798, 1000=0.03144 (USD); Mount: Surface Mount; Case/Package: TO-236-3; Case Code (Imperial): 0603; Case Code (Metric): 1608; Min Operating Temperature: -55°C; Max Operating Temperature: 125°C; Packaging: Tape and Reel; Capacitance: 47pF; Voltage Rating: 100V; Ratings: AEC-Q200; ComponentLink1URL: http://www.yageo.com/NewPortal/_en/search/productDocs.jsp?YageoPartNumber=AC0603JRNPO0BN470&src-supplier=Digi-Key; ComponentLink1Description: http://www.yageo.com/NewPortal/_en/search/productDocs.jsp?YageoPartNumber=AC0603JRNPO0BN470&src-supplier=Digi-Key; Supplier Part Number 1: 311-3086-1-ND; LCSC Part Number: C389107
J1 = 22284020: KK 254 Breakaway Header, Vertical, 2 Circuits, Tin (Sn) Plating, Mating Pin Length 6.09mm; Manufacturer: Molex; Number of Contacts: 2; Contact Resistance: 20mR; Max Voltage Rating (DC): 250V; Current Rating: 4A; Gender: Male; Connector Type: Male Pin; Pitch: 2.54mm; Glow Wire Compliant: Non-compliant; Supplier 1: Rs; Manufacturer Part Number: 22-28-4020; RoHS: Yes; Category: Headers and Wire Housings; Stock 1: 29550; Pricing 1: 50=0.06100, 150=0.05600, 250=0.05200, 500=0.04900 (GBP); Mount: Through Hole; Contact Plating: Tin; Color: Black; Contact Material: Brass,Bronze; Housing Color: Black; Housing Material: Nylon; Min Operating Temperature: 0°C; Max Operating Temperature: 75°C; Number of Rows: 1; Termination: Solder; Package Quantity: 1; Packaging: Bulk; Voltage Rating: 250V; Number of Positions: 2; Orientation: Straight; Number of Circuits: 2; Series: KK® 42375; Contact Type: Male Pin; Voltage Rating (DC): 250V; Max Voltage Rating (AC): 250V; Contact Mating Length: 0.24inch; Depth: 2.49mm; Radiation Hardening: No; Lead Free: Lead Free; RoHS Compliant: Yes; Flammability Rating: UL94 V-0; ComponentLink1URL: https://datasheet.ciiva.com/1433/1596842-1433683.pdf?src-supplier=Element14; ComponentLink1Description: https://datasheet.ciiva.com/1433/1596842-1433683.pdf?src-supplier=Element14; ComponentLink2URL: https://datasheet.ciiva.com/5157/0022284020-pcb-headers-228358-5157523.pdf?src-supplier=Mouser; ComponentLink2Description: https://datasheet.ciiva.com/5157/0022284020-pcb-headers-228358-5157523.pdf?src-supplier=Mouser; ComponentLink3URL: https://datasheet.ciiva.com/30153/214440022284020-pcb-headers-30153261.pdf?src-supplier=Onlinecomponents.com; ComponentLink3Description: https://datasheet.ciiva.com/30153/214440022284020-pcb-headers-30153261.pdf?src-supplier=Onlinecomponents.com; ComponentLink4URL: https://datasheet.ciiva.com/15217/getdatasheetpartid-127875-15217702.pdf?src-supplier=Verical; ComponentLink4Description: https://datasheet.ciiva.com/15217/getdatasheetpartid-127875-15217702.pdf?src-supplier=Verical; ComponentLink5URL: https://datasheet.ciiva.com/10088/0022284020-pcb-headers-10088332.pdf?src-supplier=Avnet; ComponentLink5Description: https://datasheet.ciiva.com/10088/0022284020-pcb-headers-10088332.pdf?src-supplier=Avnet; Supplier Part Number 1: 8967620; LCSC Part Number: C234182; Item Type: Header
J2 = C49257: 3A Straight Square Pins -40℃~+105℃ 3 2.54mm Black 1x3P Plugin,P=2.54mm Pin Headers ROHS; Manufacturer: BOOMELE; Item Type: Header; Manufacturer Part Number: C49257; LCSC Part Number: C49257; ComponentLink1Description: LCSC; ComponentLink1URL: https://www.lcsc.com/product-detail/Pin-Headers_BOOMELE-Boom-Precision-Elec-C49257_C49257.html
MK1 = ZTS6117: 1.5V~3.6V Omnidirectional 120uA -42dB 400Ω 59dB SMD-4P,1.9x2.8mm MEMS Microphones ROHS; Manufacturer: Zilltek; Manufacturer Part Number: ZTS6117; LCSC Part Number: C481300; Item Type: Microphone; ComponentLink1Description: LCSC; ComponentLink1URL: https://www.lcsc.com/product-detail/MEMS-Microphones_ZILLTEK-ZTS6117_C481300.html
R3 R4 R7 = RT0603BRD0710KL: as R2 on sheet 3_Band_Filter; Supplier 1: Rs; Manufacturer Part Number: RT0603BRD0710KL; RoHS: Yes; Category: Chip SMD Resistors; Stock 1: 20510; Pricing 1: 100=0.29800, 250=0.27800, 500=0.25900, 1000=0.23700 (GBP); Mounting Technology: Surface Mount; Pins: 2; Case/Package: 0603; Min Operating Temperature: -55°C; Max Operating Temperature: 155°C; Tolerance: 0.1%; Resistor Type: FIXED RESISTOR; Construction: Chip; Package Style: SMTMeter; Packaging: Tape and Reel; Technology: THIN FILM; Termination: Wraparound; Reach SVHC Compliant: Yes; RoHS Compliant: Yes; ComponentLink1URL: https://datasheet.ciiva.com:443/pdfs/VipMasterIC/IC/YAGO/YAGO-S-A0008510989/YAGO-S-A0008510989-1.pdf?src-supplier=IHS+Markit; ComponentLink1Description: https://datasheet.ciiva.com:443/pdfs/VipMasterIC/IC/YAGO/YAGO-S-A0008510989/YAGO-S-A0008510989-1.pdf?src-supplier=IHS+Markit; ComponentLink2URL: https://datasheet.ciiva.com/5624/pyu-rt-1-to-0-05-rohs-l-4-5624351.pdf?src-supplier=Mouser; ComponentLink2Description: https://datasheet.ciiva.com/5624/pyu-rt-1-to-0-05-rohs-l-4-5624351.pdf?src-supplier=Mouser; ComponentLink3URL: https://datasheet.ciiva.com/29721/pyu-rt-1-to-0-05-rohs-l-4-29721177.pdf?src-supplier=Digi-Key; ComponentLink3Description: https://datasheet.ciiva.com/29721/pyu-rt-1-to-0-05-rohs-l-4-29721177.pdf?src-supplier=Digi-Key; Supplier Part Number 1: 1991391P; LCSC Part Number: C95204
R5 = VG039NCHXTB504: ±25% 500kΩ SMD Variable Resistors/Potentiometers ROHS; Manufacturer: HDK; Manufacturer Part Number: VG039NCHXTB504; LCSC Part Number: C128558; Item Type: Potentiometer; ComponentLink1Description: LCSC; ComponentLink1URL: https://www.lcsc.com/product-detail/Variable-Resistors-Potentiometers_HDK-Hokuriku-Elec-Industry-VG039NCHXTB504_C128558.html; Value: 500k
R6 = RT0603BRD071KL: RES SMD 1K OHM 0.1% 1/10W 0603; Manufacturer: Yageo; Resistance: 1kR; Power Rating: 100mW; Voltage Rating: 75V; Temperature Coefficient: 25ppm/°C; Voltage Rating (DC): 50V; Item Type: Resistor; Supplier 1: Arrow Electronics; Manufacturer Part Number: RT0603BRD071KL; RoHS: Yes; Category: Chip SMD Resistors; Stock 1: 130000; Pricing 1: 5000=0.03900, 10000=0.03450, 25000=0.03070, 50000=0.02040 (USD); Mount: Surface Mount; Case/Package: 0603; Case Code (Metric): 1608; Case Code (Imperial): 0603; Contact Plating: Tin,Lead; Size Code: 0603; Min Operating Temperature: -55°C; Max Operating Temperature: 125°C; Package Quantity: 5000; Packaging: Tape and Reel; Resistor Type: Thin Film; Number of Terminations: 2; Termination: SMD/SMT; Max Power Dissipation: 100mW; Features: Moisture Resistant; Series: RT; Technology: THIN FILM; Construction: Rectangular; Length: 1.6mm; Width: 0.031inch; Height: 0.022inch; Depth: 0.8mm; Military Standard: Not; Lead Free: Lead Free; RoHS Compliant: Yes; ComponentLink1URL: https://datasheet.ciiva.com/11819/0900766b8079c86e-11819652.pdf?src-supplier=RSComponents; ComponentLink1Description: https://datasheet.ciiva.com/11819/0900766b8079c86e-11819652.pdf?src-supplier=RSComponents; ComponentLink2URL: https://datasheet.ciiva.com/5624/pyu-rt-1-to-0-05-rohs-l-4-5624759.pdf?src-supplier=Mouser; ComponentLink2Description: https://datasheet.ciiva.com/5624/pyu-rt-1-to-0-05-rohs-l-4-5624759.pdf?src-supplier=Mouser; ComponentLink3URL: https://datasheet.ciiva.com/29718/pyu-rt-1-to-0-05-rohs-l-4-29718010.pdf?src-supplier=Digi-Key; ComponentLink3Description: https://datasheet.ciiva.com/29718/pyu-rt-1-to-0-05-rohs-l-4-29718010.pdf?src-supplier=Digi-Key; ComponentLink4URL: https://datasheet.ciiva.com/29718/pyu-rt-1-to-0-05-rohs-l-4-29718011.pdf?src-supplier=Digi-Key; ComponentLink4Description: https://datasheet.ciiva.com/29718/pyu-rt-1-to-0-05-rohs-l-4-29718011.pdf?src-supplier=Digi-Key; Supplier Part Number 1: RT0603BRD071KL; LCSC Part Number: C110776
SB1 = Solder Bridge: Solder Bridge ON; Manufacturer Part Number: Solder Bridge; Item Type: Solder Bridge
U1 = LM2904DT: as U1 on sheet 3_Band_Filter; Supplier 1: Mouser; Manufacturer Part Number: LM2904DT; RoHS: Yes; Category: Amplifiers - Op Amps, Buffer, Instrumentation; Stock 1: 104539; Pricing 1: 1=0.44000, 10=0.34900, 50=0.34900, 100=0.25900, 1000=0.17000, 10000=0.15000 (USD); Mount: Surface Mount; Case/Package: SOIC; Number of Pins: 8; Contact Plating: Gold; Weight: 0.01lb; Package Shape: Rectangular; Terminal Finish: Nickel; Min Operating Temperature: -40°C; Max Operating Temperature: 125°C; Packaging: Tape and Reel; Gain Bandwidth Product: 1.1MHz; Number of Circuits: 2; Package Quantity: 2500; Operating Supply Voltage: 15V; Supply Current: 1.2mA; Technology: BIPOLAR; Series: -; Output Current per Channel: 40mA; Number of Elements: 2; Number of Amplifiers: 2; Amplifier Type: GENERAL PURPOSE; Unity Gain Bandwidth Product: 1.1MHz; Number of Functions: 2; Terminal Form: Gull Wing; Terminal Position: DUAL; Moisture Sensitivity Level: 1; JESD-30 Code: R-PDSO-G8; Surface Mount: Yes; Peak Reflow Temperature (Cel): 260°C; Input Offset Voltage-Max: 7mV; Slew Rate-Nom: 0.6V/µs; Length: 4.9mm; Width: 3.9mm; Height: 1.25mm; Radiation Hardening: No; Reach SVHC Compliant: Yes; Lead Free: Contains Lead; RoHS Compliant: Yes; Temperature Grade: AUTOMOTIVE; ComponentLink1URL: https://datasheet.ciiva.com/5703/1802155-5703335.pdf?src-supplier=Farnell; ComponentLink1Description: https://datasheet.ciiva.com/5703/1802155-5703335.pdf?src-supplier=Farnell; ComponentLink2URL: https://datasheet.ciiva.com/27055/1993227-27055857.pdf?src-supplier=Jameco; ComponentLink2Description: https://datasheet.ciiva.com/27055/1993227-27055857.pdf?src-supplier=Jameco; ComponentLink3URL: https://datasheet.ciiva.com/15129/getdatasheetpartid-32489-15129656.pdf?src-supplier=Verical; ComponentLink3Description: https://datasheet.ciiva.com/15129/getdatasheetpartid-32489-15129656.pdf?src-supplier=Verical; ComponentLink4URL: https://datasheet.ciiva.com/41459/001185000-da-01-en-ic-op-amp-low-pwr-du-lm2904dt-soic-8-stm-41459659.pdf?src-supplier=Conrad; ComponentLink4Description: https://datasheet.ciiva.com/41459/001185000-da-01-en-ic-op-amp-low-pwr-du-lm2904dt-soic-8-stm-41459659.pdf?src-supplier=Conrad; ComponentLink5URL: https://datasheet.ciiva.com/1795/cd00000535-1795476.pdf?src-supplier=Digi-Key; ComponentLink5Description: https://datasheet.ciiva.com/1795/cd00000535-1795476.pdf?src-supplier=Digi-Key; ComponentLink6URL: https://datasheet.ciiva.com/1795/cd00000535-1795475.pdf?src-supplier=Digi-Key; ComponentLink6Description: https://datasheet.ciiva.com/1795/cd00000535-1795475.pdf?src-supplier=Digi-Key; ComponentLink7URL: https://datasheet.ciiva.com/1795/cd00000535-1795477.pdf?src-supplier=Digi-Key; ComponentLink7Description: https://datasheet.ciiva.com/1795/cd00000535-1795477.pdf?src-supplier=Digi-Key; ComponentLink8URL: https://datasheet.ciiva.com/16200/cd00000535-16200605.pdf?src-supplier=Future+Electronics; ComponentLink8Description: https://datasheet.ciiva.com/16200/cd00000535-16200605.pdf?src-supplier=Future+Electronics; Supplier Part Number 1: 511-LM2904DT; LCSC Part Number: C105411

## Nets that join several sheets
GND: Notch_Filter (C13.2 R54.2 R69.2 U3.4), 3_Band_Filter (7 pins), Gain (8 pins)
VCC: Notch_Filter (C13.1 R68.2 U3.8), 3_Band_Filter (C10.1 R48.2 R65.2 U2.8), Gain (6 pins)
3BAND_OUT: Notch_Filter (C19.1), 3_Band_Filter (SB2.2)
3BAND_OUT#: 3_Band_Filter (C18.2 R13.1 SB2.1), Gain (J2.2)
GAIN_OUT: 3_Band_Filter (C8.1), Gain (SB1.2)
NOTCH_OUT: Notch_Filter (R67.2 U3.1 U3.2), Gain (J2.3)